# Altium schematic sheet main.SchDoc
size D; SheetNumber: 1; SheetTotal: 1
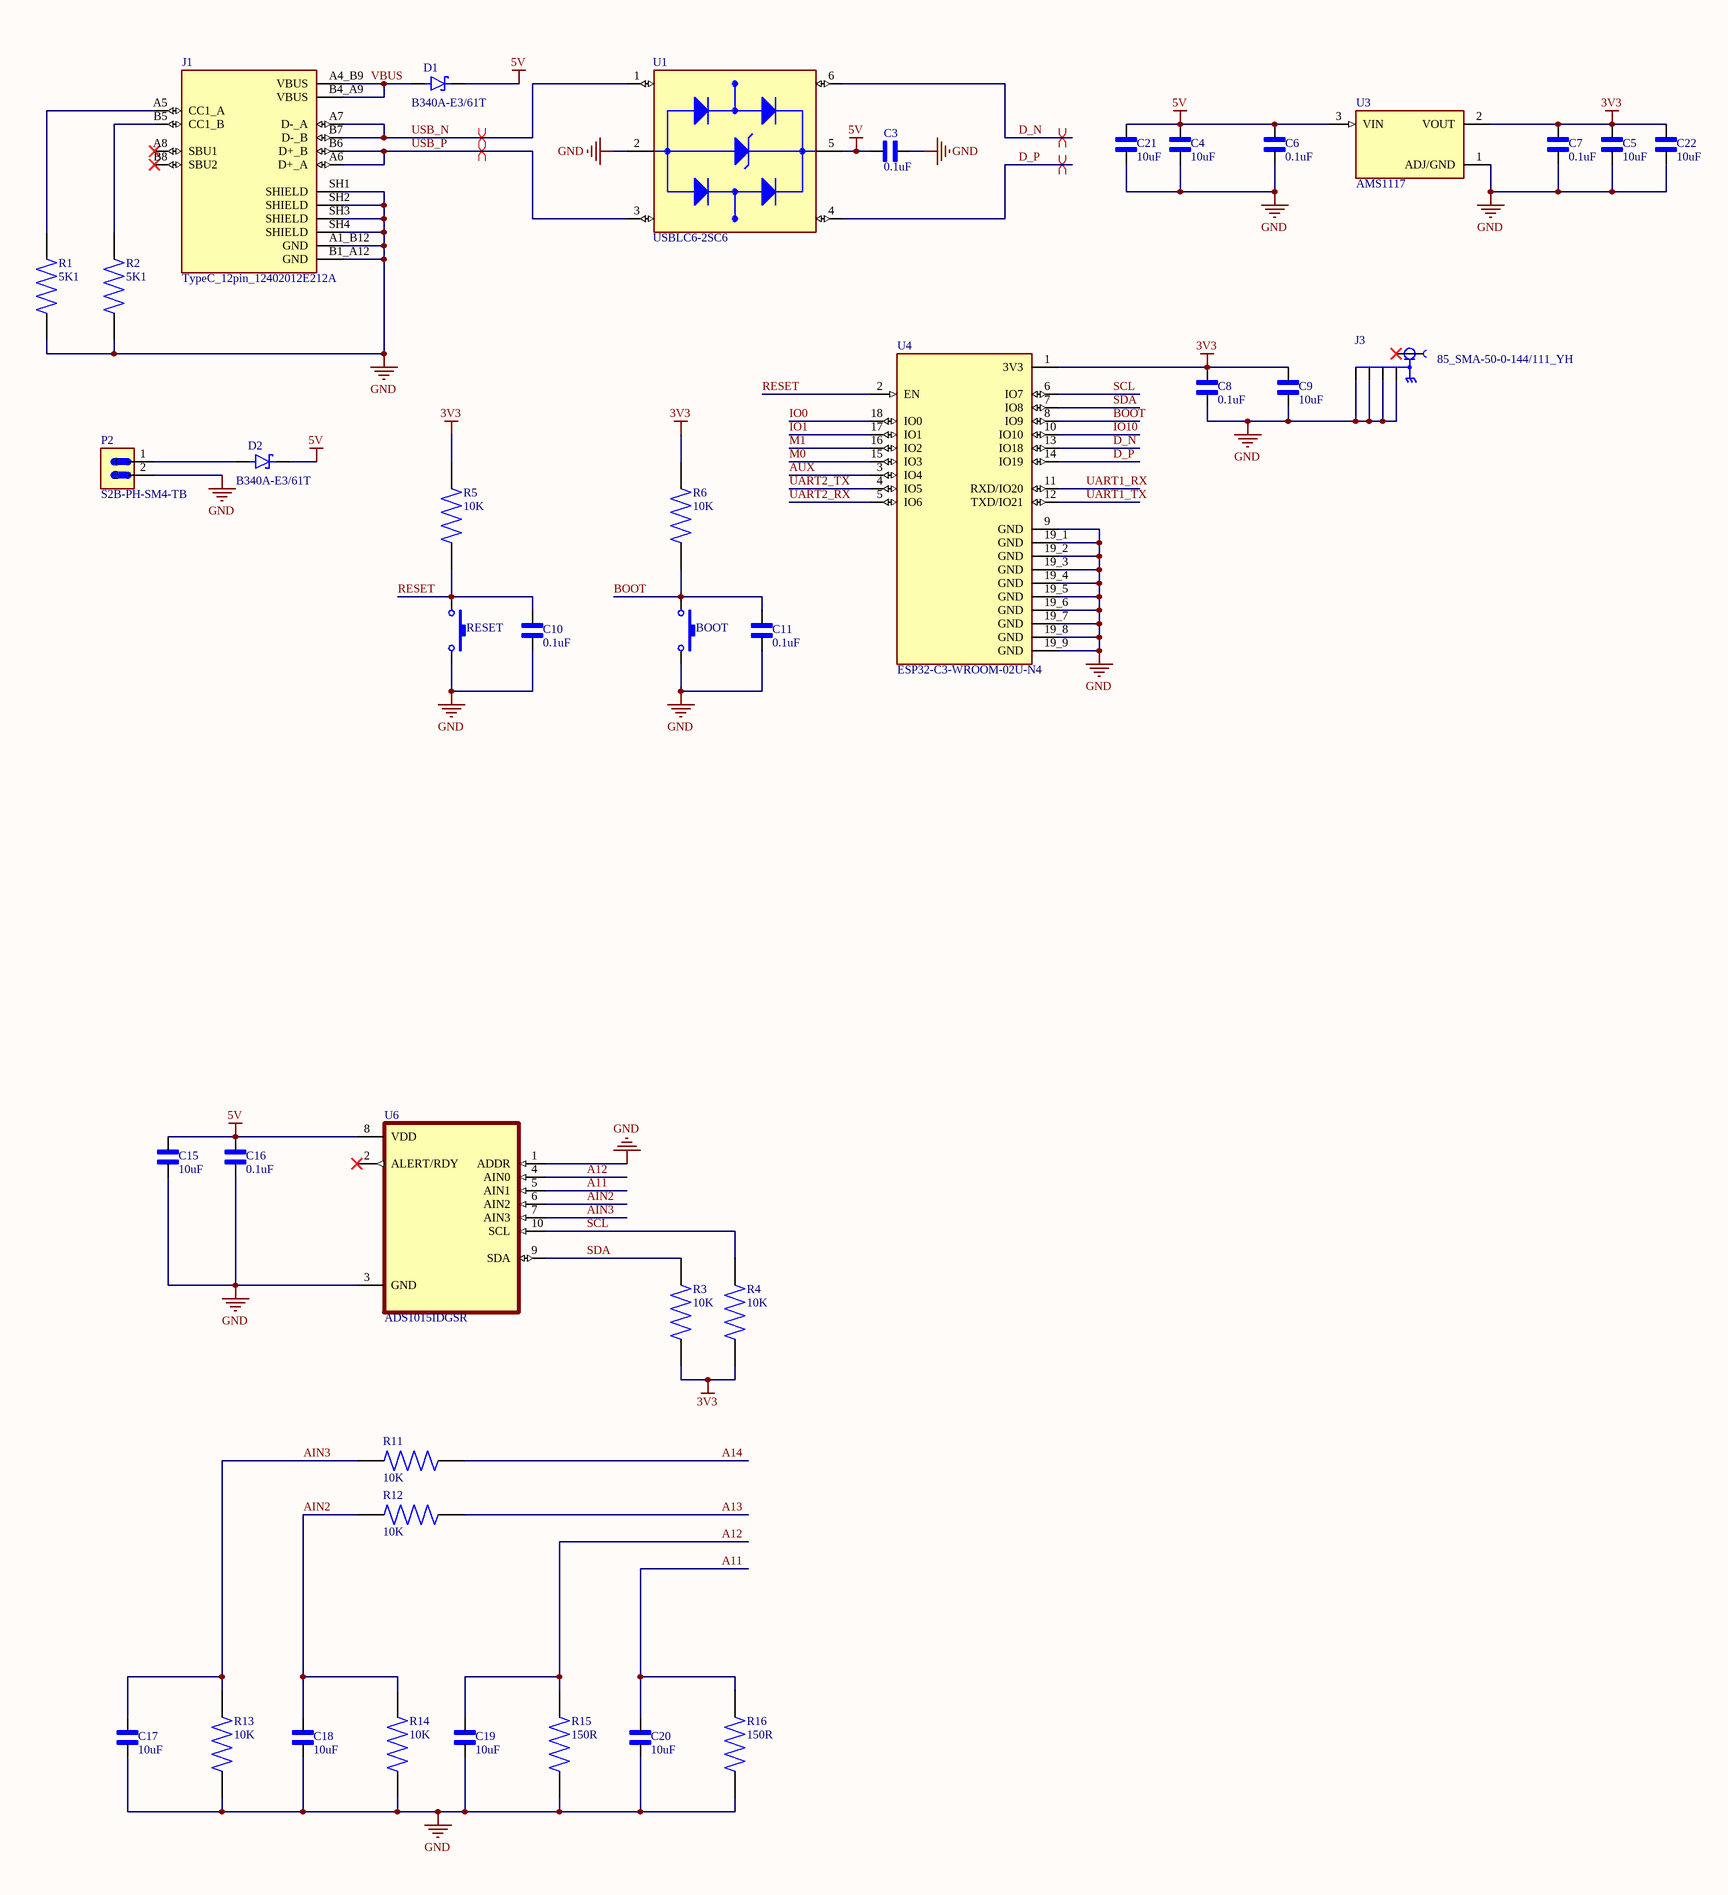
[diagram p0: main.SchDoc, left]
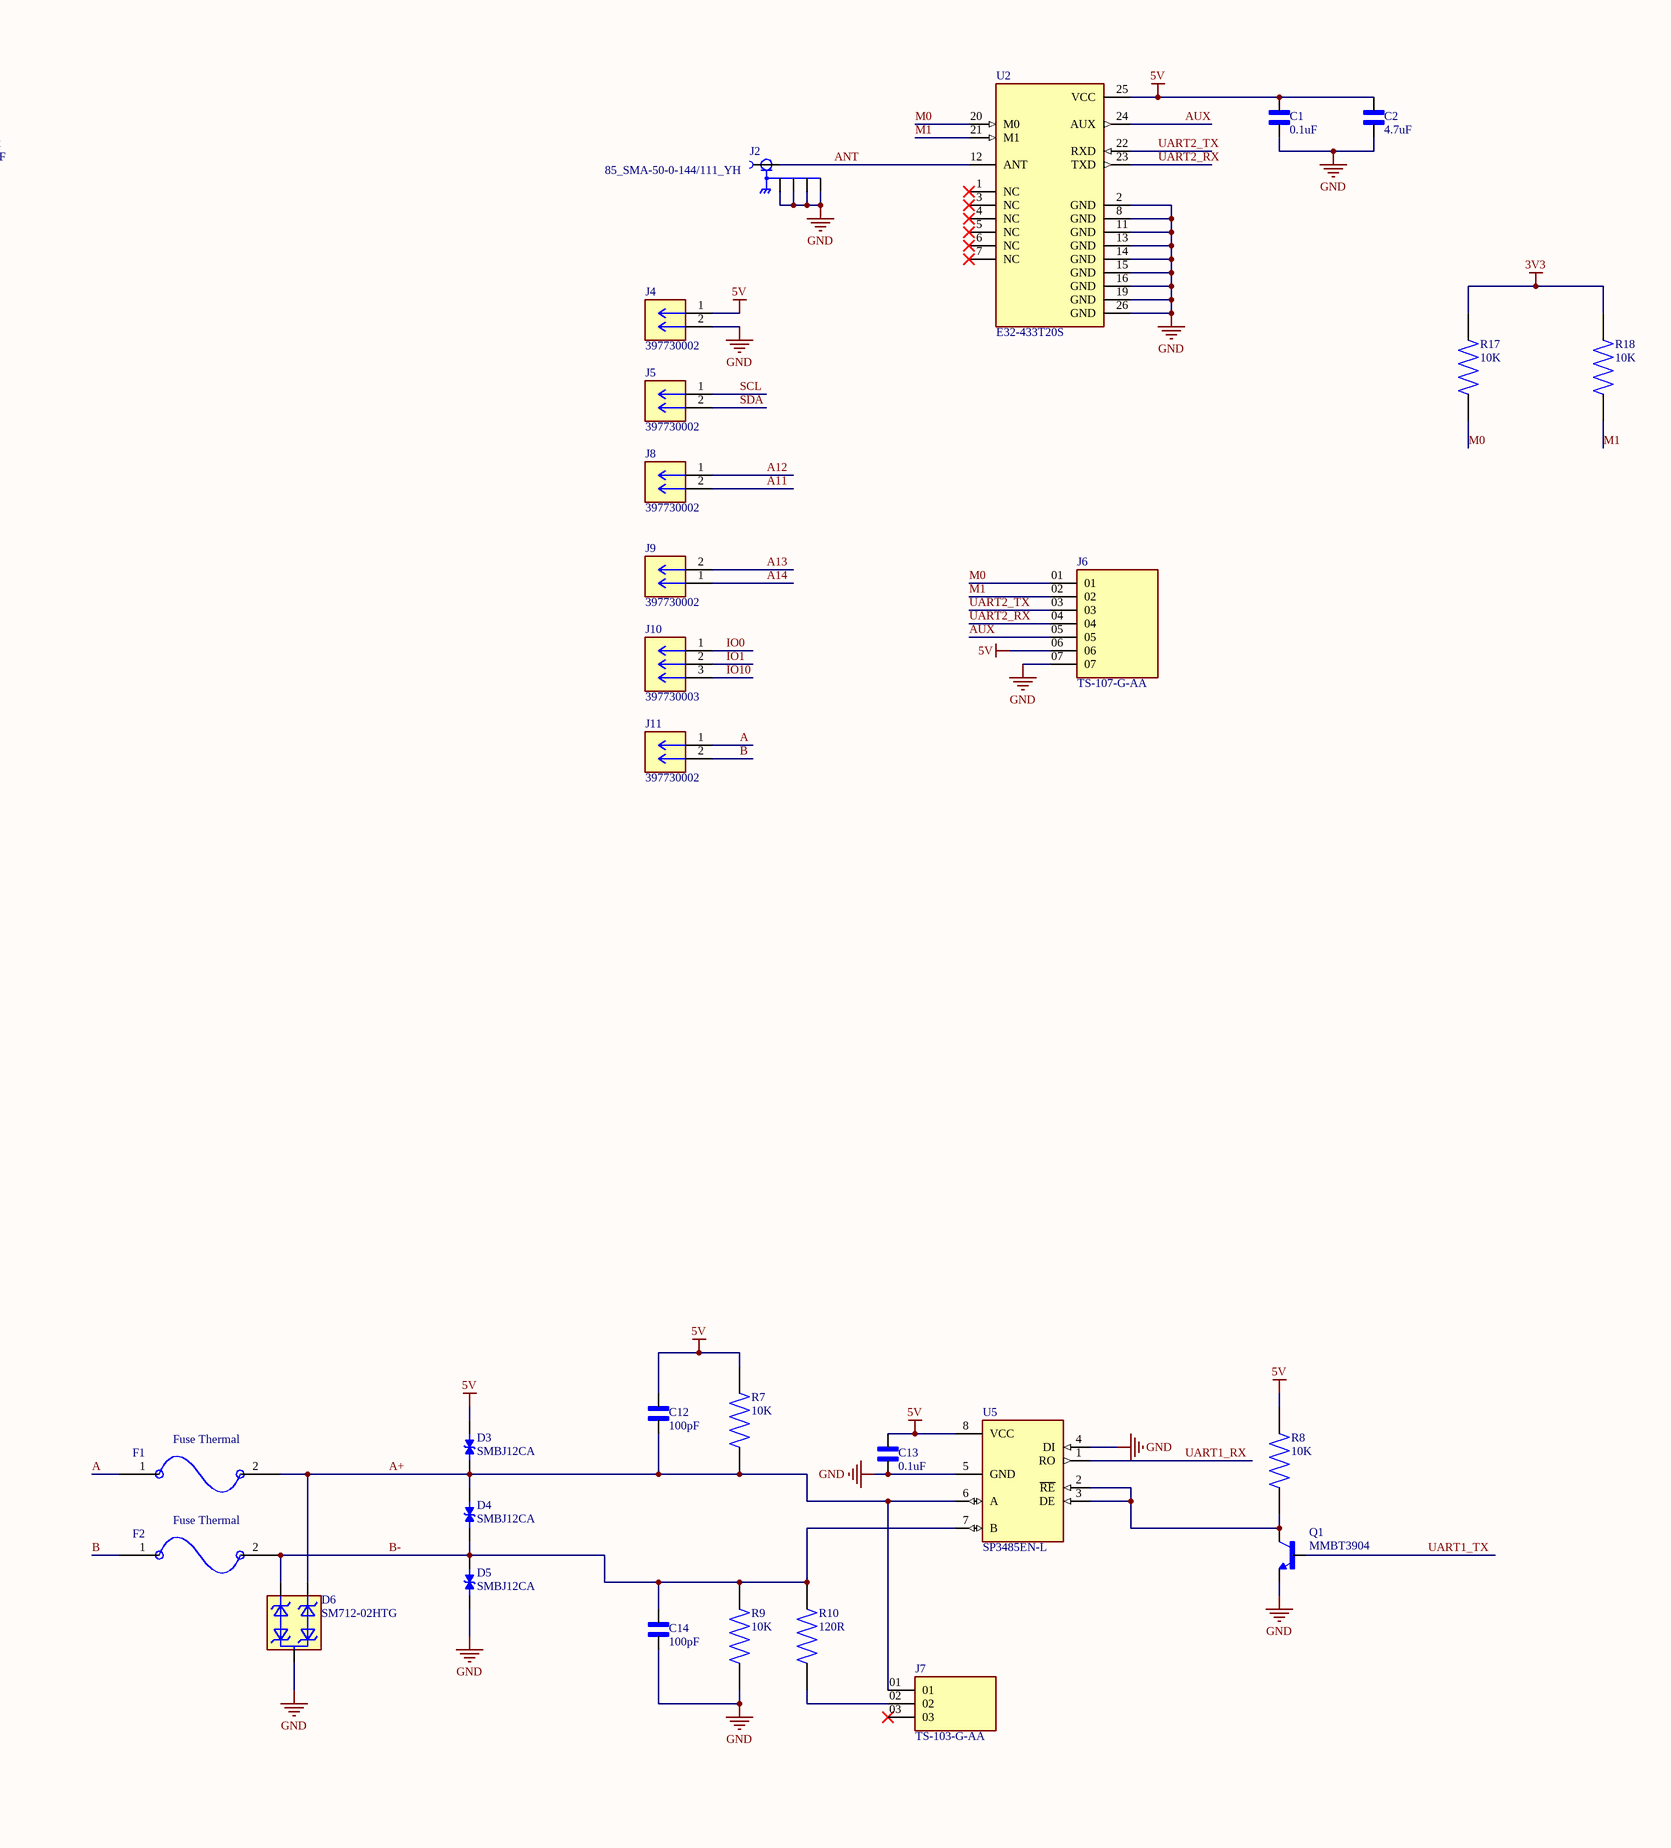
[diagram p1: main.SchDoc, right]

## Parts
BOOT  Nut Nhan 2 Chan SMD 3x6x2.5  [PCBComponent_1]  (value not drawn)
C1  0.1uF  [CAPC1005X61N]
C2  4.7uF  [CAPC1005X61N]
C3  0.1uF  [CAPC1608X94N]
C4  10uF  [CAPC1608X94N]
C5  10uF  [CAPC1608X94N]
C6  0.1uF  [CAPC1608X94N]
C7  0.1uF  [CAPC1608X94N]
C8  0.1uF  [CAPC1608X94N]
C9  10uF  [CAPC1608X94N]
C10  0.1uF  [CAPC1005X61N]
C11  0.1uF  [CAPC1005X61N]
C12  100pF  [CAPC1005X61N]
C13  0.1uF  [CAPC1005X61N]
C14  100pF  [CAPC1005X61N]
C15  10uF  [CAPC1608X94N]
C16  0.1uF  [CAPC1608X94N]
C17  10uF  [CAPC1608X94N]
C18  10uF  [CAPC1608X94N]
C19  10uF  [CAPC1608X94N]
C20  10uF  [CAPC1608X94N]
C21  10uF  [CAPC1608X94N]
C22  10uF  [CAPC1608X94N]
D1  B340A-E3/61T  [DIOM5126X229N]
D2  B340A-E3/61T  [DIOM5126X229N]
D3  SMBJ12CA  [DIOM4336X265N]
D4  SMBJ12CA  [DIOM4336X265N]
D5  SMBJ12CA  [DIOM4336X265N]
D6  SM712-02HTG  [SOT23]
F1  Fuse Thermal  [RES_ERJU08J224V]
F2  Fuse Thermal  [RES_ERJU08J224V]
J1  TypeC_12pin_12402012E212A  [TypeC_12pin_12402012E212A]
J2  85_SMA-50-0-144/111_YH  [HUBER+SUHNER_85_SMA-50-0-144/111_YH]
J3  85_SMA-50-0-144/111_YH  [HUBER+SUHNER_85_SMA-50-0-144/111_YH]
J4  397730002  [CONN_39773-0002_MOL]
J5  397730002  [CONN_39773-0002_MOL]
J6  TS-107-G-AA  [SAMTEC_TS-107-G-AA]
J7  TS-103-G-AA  [SAMTEC_TS-103-G-AA]
J8  397730002  [CONN_39773-0002_MOL]
J9  397730002  [CONN_39773-0002_MOL]
J10  397730003  [CONN_39773-0003_MOL]
J11  397730002  [CONN_39773-0002_MOL]
P2  S2B-PH-SM4-TB  [JST_S2B-PH-SM4-TB]
Q1  MMBT3904  [TRANS_MMBT3904]
R1  5K1  [RES_ERJU02F5102X]
R2  5K1  [RES_ERJU02F5102X]
R3  10K  [RES_ERJU03J474V]
R4  10K  [RES_ERJU03J474V]
R5  10K  [RES_ERJU02F5102X]
R6  10K  [RES_ERJU02F5102X]
R7  10K  [RES_ERJU02F5102X]
R8  10K  [RES_ERJU02F5102X]
R9  10K  [RES_ERJU02F5102X]
R10  120R  [RES_ERJU02F5102X]
R11  10K  [RES_ERJU03J474V]
R12  10K  [RES_ERJU03J474V]
R13  10K  [RES_ERJU03J474V]
R14  10K  [RES_ERJU03J474V]
R15  150R  [RES_ERJU03J474V]
R16  150R  [RES_ERJU03J474V]
R17  10K  [RES_ERJU03J474V]
R18  10K  [RES_ERJU03J474V]
RESET  Nut Nhan 2 Chan SMD 3x6x2.5  [PCBComponent_1]  (value not drawn)
U1  USBLC6-2SC6  [USBLC6-2SC6]
U2  E32-433T20S  [MODULE_E32-433T20S]
U3  AMS1117  [SOT229P700X180-4N]
U4  ESP32-C3-WROOM-02U-N4  [XCVR_ESP32-C3-WROOM-02U-N4]
U5  SP3485EN-L  [SOIC127P599X175-8N]
U6  ADS1015IDGSR  [SOP50P490X110-10N]

## Nets
3V3: C5.2 C7.2 C8.2 C9.2 C22.2 R3.2 R4.2 R5.1 R6.1 R17.1 R18.1 U3.2(VOUT) U4.1(3V3)
5V: C1.2 C2.2 C3.2 C4.2 C6.2 C12.2 C13.2 C15.2 C16.2 C21.2 D1.C D2.C D3.2 J4.1 J6.06 R7.1 R8.1 U1.5(VBUS) U2.25(VCC) U3.3(VIN) U5.8(VCC) U6.8(VDD)
GND: BOOT.2 C1.1 C2.1 C3.1 C4.1 C5.1 C6.1 C7.1 C8.1 C9.1 C10.1 C11.1 C13.1 C14.1 C15.1 C16.1 C17.1 C18.1 C19.1 C20.1 C21.1 C22.1 D5.1 D6.3 J1.A1_B12(GND) J1.B1_A12(GND) J1.SH1(SHIELD) J1.SH2(SHIELD) J1.SH3(SHIELD) J1.SH4(SHIELD) J2.G1 J2.G2 J2.G3 J2.G4 J3.G1 J3.G2 J3.G3 J3.G4 J4.2 J6.07 P2.2 Q1.2(E) R1.1 R2.1 R9.2 R13.2 R14.2 R15.2 R16.2 RESET.2 U1.2(GND) U2.2(GND) U2.8(GND) U2.11(GND) U2.13(GND) U2.14(GND) U2.15(GND) U2.16(GND) U2.19(GND) U2.26(GND) U3.1(ADJ/GND) U4.9(GND) U4.19_1(GND) U4.19_2(GND) U4.19_3(GND) U4.19_4(GND) U4.19_5(GND) U4.19_6(GND) U4.19_7(GND) U4.19_8(GND) U4.19_9(GND) U5.4(DI) U5.5(GND) U6.1(ADDR) U6.3(GND)
A: F1.1 J11.1
A11: C20.2 J8.2 R16.1 U6.5(AIN1)
A12: C19.2 J8.1 R15.1 U6.4(AIN0)
A13: J9.2 R12.1
A14: J9.1 R11.1
A+: C12.1 D3.1 D4.2 D6.1 F1.2 J7.01 R7.2 U5.6(A)
AIN2: C18.2 R12.2 R14.1 U6.6(AIN2)
AIN3: C17.2 R11.2 R13.1 U6.7(AIN3)
ANT: J2.1 U2.12(ANT)
AUX: J6.05 U2.24(AUX) U4.3(IO4)
B: F2.1 J11.2
B-: C14.2 D4.1 D5.2 D6.2 F2.2 R9.1 R10.1 U5.7(B)
BOOT: BOOT.1 C11.2 R6.2 U4.8(IO9)
D_N: U1.6(I/O1_OUT) U4.13(IO18)
D_P: U1.4(I/O2_OUT) U4.14(IO19)
IO0: J10.1 U4.18(IO0)
IO1: J10.2 U4.17(IO1)
IO10: J10.3 U4.10(IO10)
M0: J6.01 R17.2 U2.20(M0) U4.15(IO3)
M1: J6.02 R18.2 U2.21(M1) U4.16(IO2)
RESET: C10.2 R5.2 RESET.1 U4.2(EN)
SCL: J5.1 R4.1 U4.6(IO7) U6.10(SCL)
SDA: J5.2 R3.1 U4.7(IO8) U6.9(SDA)
UART1_RX: U4.11(RXD/IO20) U5.1(RO)
UART1_TX: Q1.1(B) U4.12(TXD/IO21)
UART2_RX: J6.04 U2.23(TXD) U4.5(IO6)
UART2_TX: J6.03 U2.22(RXD) U4.4(IO5)
USB_N: J1.A7(D-_A) J1.B7(D-_B) U1.1(I/O1_IN)
USB_P: J1.A6(D+_A) J1.B6(D+_B) U1.3(I/O2_IN)
VBUS: D1.A J1.A4_B9(VBUS) J1.B4_A9(VBUS)
NetD2_A: D2.A P2.1
NetJ1_A5: J1.A5(CC1_A) R1.2
NetJ1_B5: J1.B5(CC1_B) R2.2
NetJ7_02: J7.02 R10.2
NetQ1_3: Q1.3(C) R8.2 U5.2(~{RE}) U5.3(DE)

Not connected (* = marked no-connect by the designer): J1 A8(SBU1)* B8(SBU2)*; J3 1*; J7 03*; U2 1(NC)* 3(NC)* 4(NC)* 5(NC)* 6(NC)* 7(NC)*; U6 2(ALERT/RDY)*

## Layout directives
differential pair: D_N, D_P, USB_N, USB_P

## Library data of the parts
BOOT RESET = Nut Nhan 2 Chan SMD 3x6x2.5: Ma_Hang: MH001036; Ten: Nút Nhấn 2 Chân 3x6x2.5MM SMD
C1 C2 C10-C14 = cap_0402_VJ0402D100MXCAP: cap 0402; MF: Vishay Vitramon; SnapEDA_Link: https://www.snapeda.com/parts/VJ0402D100MXCAP/Vishay/view-part/?ref=snap; Package: 1005 Vishay Vitramon; Value: *; MP: VJ0402D100MXCAP; Check_prices: https://www.snapeda.com/parts/VJ0402D100MXCAP/Vishay/view-part/?ref=eda
C3-C9 C15-C22 = cap_0603_VJ0603D3R9DXCAP: cap 0603 (1608 Metric); MF: Vishay Vitramon; SnapEDA_Link: https://www.snapeda.com/parts/VJ0603D3R9DXCAP/Vishay/view-part/?ref=snap; Package: 1608 Vishay Vitramon; Value: *; MP: VJ0603D3R9DXCAP; Check_prices: https://www.snapeda.com/parts/VJ0603D3R9DXCAP/Vishay/view-part/?ref=eda
D1 D2 = B340A-E3/61T: Diode Schottky 40 V 3A Surface Mount DO-214AC (SMA); MF: Vishay Semiconductor; SnapEDA_Link: https://www.snapeda.com/parts/B340A-E3/61T/Vishay/view-part/?ref=snap; Package: DO-214 Vishay Semiconductor; Value: *; MP: B340A-E3/61T; Check_prices: https://www.snapeda.com/parts/B340A-E3/61T/Vishay/view-part/?ref=eda
D3-D5 = SMBJ10CA-13-F: MF: {'manufacturer': u'Diodes Incorporated'}; Package: None; Price: None; Value: *; MP: SMBJ10CA-13-F; Availability: Unavailable
D6 = SM712-02HTG: TVS Diode, SM712 Series, 31V Clamp, 600W Peak Pulse, Surface Mount, SOT23-3 | Littelfuse SM712-02HTG; MF: Littelfuse Inc.; SnapEDA_Link: https://www.snapeda.com/parts/SM712-02HTG/Littelfuse/view-part/?ref=snap; Package: SOT-23 Littelfuse Inc.; Value: *; MP: SM712-02HTG; Check_prices: https://www.snapeda.com/parts/SM712-02HTG/Littelfuse/view-part/?ref=eda
F1 F2 = Fuse Thermal: Fuse, Resettable, Fast Acting, 10A, Sz 1206, 0.134x0.071x0.033", SMT, 24VDC, PCB | Bourns MF-NSMF200-2
J1 = TypeC_12pin_12402012E212A: USB2.0, Type C, Top mount, CH 1.68mm, Dual Row SMT; MF: Amphenol ICC (Commercial Products); MP: 12402012E212A; Price: None; Package: None; Availability: In Stock; SnapEDA_Link: https://www.snapeda.com/parts/12402012E212A/Amphenol/view-part/?ref=snap; Value: *; Check_prices: https://www.snapeda.com/parts/12402012E212A/Amphenol/view-part/?ref=eda; Purchase-URL: https://pricing.snapeda.com/search/part/12402012E212A/?ref=eda
J2 J3 = 85_SMA-50-0-144/111_YH: RF Connector, SMA Right angle PCB jack(f) | HUBER+SUHNER 85_SMA-50-0-144/111_YH; SnapEDA_Link: https://www.snapeda.com/parts/85_SMA-50-0-144/111_YH/Huber%252BSuhner/view-part/?ref=snap; Package: None; Value: *; MF: HUBER+SUHNER; MP: 85_SMA-50-0-144/111_YH; Check_prices: https://www.snapeda.com/parts/85_SMA-50-0-144/111_YH/Huber%252BSuhner/view-part/?ref=eda
J4 J5 J8 J9 J11 = 397730002: 2 Position Wire to Board Terminal Block Horizontal with Board 0.100 (2.54mm) Through Hole; MF: Molex; SnapEDA_Link: https://www.snapeda.com/parts/397730002/Molex/view-part/?ref=snap; Package: None; Value: *; MP: 397730002; Check_prices: https://www.snapeda.com/parts/397730002/Molex/view-part/?ref=eda
J6 = TS-107-G-AA: Conn Unshrouded Header HDR 7 POS 2.54mm Solder ST Top Entry Thru-Hole Tube; MF: Samtec Inc.; Value: *; MP: TS-107-G-AA; Package: None; Check_prices: https://www.snapeda.com/parts/TS-107-G-AA/Samtec/view-part/4675875/?ref=eda; Purchase-URL: https://pricing.snapeda.com/search/part/TS-107-G-AA/?ref=eda; Price: None; SnapEDA_Link: https://www.snapeda.com/parts/TS-107-G-AA/Samtec/view-part/4675875/?ref=snap; Availability: In Stock
J7 = TS-103-G-AA: Conn Unshrouded Header HDR 3 POS 2.54mm Solder ST Thru-Hole Bulk; MF: Samtec; MP: TS-103-G-AA; Price: None; Purchase-URL: https://pricing.snapeda.com/search/part/TS-103-G-AA/?ref=eda; Package: None; Check_prices: https://www.snapeda.com/parts/TS-103-G-AA/Samtec/view-part/?ref=eda; Value: *; Availability: In Stock; SnapEDA_Link: https://www.snapeda.com/parts/TS-103-G-AA/Samtec/view-part/?ref=snap
J10 = 397730003: 3 Position Wire to Board Terminal Block Horizontal with Board 0.100 (2.54mm) Through Hole; MF: Molex; MP: 0397730003; SnapEDA_Link: https://www.snapeda.com/parts/0397730003/Molex/view-part/?ref=snap; Package: None; Value: *; Check_prices: https://www.snapeda.com/parts/0397730003/Molex/view-part/?ref=eda
P2 = S2B-PH-SM4-TB: Connector Header Surface Mount, Right Angle 2 position 0.079 (2.00mm); MF: JST Sales; SnapEDA_Link: https://www.snapeda.com/parts/S2B-PH-SM4-TB/JST/view-part/?ref=snap; Package: None; Value: *; MP: S2B-PH-SM4-TB; Check_prices: https://www.snapeda.com/parts/S2B-PH-SM4-TB/JST/view-part/?ref=eda
Q1 = MMBT3904: BJT, SOT-23, 40V, 200mA, NPN, 0.35W, 150Â°C; MF: Diotec Semiconductor; SnapEDA_Link: https://www.snapeda.com/parts/MMBT3904/Diotec/view-part/?ref=snap; Package: SOT-23 Diotec; Value: *; MP: MMBT3904; Check_prices: https://www.snapeda.com/parts/MMBT3904/Diotec/view-part/?ref=eda
R1 R2 R5-R10 = res_0402_ERJU02F5102X: Availability: Unavailable; MP: ERJU02F5102X; Price: None; Package: None; Value: *
R3 R4 R11-R18 = res_0603_ERJU03J474V: 0603 Anti-Sulfurated; MF: Panasonic; SnapEDA_Link: https://www.snapeda.com/parts/ERJU03J474V/Panasonic/view-part/?ref=snap; Package: 1608-2 Panasonic; Value: *; MP: ERJU03J474V; Check_prices: https://www.snapeda.com/parts/ERJU03J474V/Panasonic/view-part/?ref=eda
U1 = USBLC6-2SC6: 17V Clamp 5A (8/20Âµs) Ipp Tvs Diode Surface Mount SOT-23-6; MF: STMicroelectronics; Value: *; SnapEDA_Link: https://www.snapeda.com/parts/USBLC6-2SC6/STMicroelectronics/view-part/?ref=snap; Check_prices: https://www.snapeda.com/parts/USBLC6-2SC6/STMicroelectronics/view-part/?ref=eda; Purchase-URL: https://pricing.snapeda.com/search/part/USBLC6-2SC6/?ref=eda; Price: None; Availability: In Stock; Package: SOT-23-6 STMicroelectronics; MP: USBLC6-2SC6
U2 = E32-433T20S: Wireless serial port module (UART); MF: EBYTE; Check_prices: https://www.snapeda.com/parts/E32-433T20S/EBYTE/view-part/?ref=eda; Package: Package; MP: E32-433T20S; Value: *; SnapEDA_Link: https://www.snapeda.com/parts/E32-433T20S/EBYTE/view-part/?ref=snap; Price: None; Availability: Not in stock
U3 = AMS1117: 1A LOW DROPOUT VOLTAGE REGULATOR SOT-223; MF: Advanced Monolithic Systems; SnapEDA_Link: https://www.snapeda.com/parts/AMS1117/Advanced+Monolithic+Systems/view-part/?ref=snap; Package: SOT-223 Seeed Technology; Value: *; MP: AMS1117; Check_prices: https://www.snapeda.com/parts/AMS1117/Advanced+Monolithic+Systems/view-part/?ref=eda
U4 = ESP32-C3-WROOM-02U-N4: Bluetooth, WiFi 802.11b/g/n, Bluetooth v5.0 Transceiver Module 2.4GHz Antenna Not Included, U.FL Surface Mount; MF: Espressif Systems; SnapEDA_Link: https://www.snapeda.com/parts/ESP32-C3-WROOM-02U-N4/Espressif+Systems/view-part/?ref=snap; Package: SMD-19 Espressif Systems; Value: *; MP: ESP32-C3-WROOM-02U-N4; Check_prices: https://www.snapeda.com/parts/ESP32-C3-WROOM-02U-N4/Espressif+Systems/view-part/?ref=eda
U5 = SP3485EN-L: 1/1 Transceiver Half RS422, RS485 8-SOIC; MF: MaxLinear, Inc.; SnapEDA_Link: https://www.snapeda.com/parts/SP3485EN-L/MaxLinear/view-part/?ref=snap; Package: None; Value: *; MP: SP3485EN-L; Check_prices: https://www.snapeda.com/parts/SP3485EN-L/MaxLinear/view-part/?ref=eda
U6 = ADS1015IDGSR: 12-bit, 3.3-kSPS, 4-channel, delta-sigma ADC with PGA, oscillator, VREF, comparator and I2C; MF: Texas Instruments; SnapEDA_Link: https://www.snapeda.com/parts/ADS1015IDGSR/Texas+Instruments/view-part/?ref=snap; Package: VSSOP-10 Texas Instruments; Value: *; MP: ADS1015IDGSR; Check_prices: https://www.snapeda.com/parts/ADS1015IDGSR/Texas+Instruments/view-part/?ref=eda